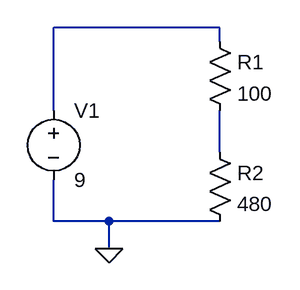
[diagram p0: schematic C5.asc]
C5.asc, the LTspice schematic file:
Version 4
SHEET 1 880 680
WIRE 272 32 80 32
WIRE 272 48 272 32
WIRE 80 128 80 32
WIRE 272 176 272 128
WIRE 80 256 80 208
WIRE 144 256 80 256
WIRE 272 256 144 256
WIRE 144 288 144 256
FLAG 144 288 0
SYMBOL res 256 32 R0
SYMATTR InstName R1
SYMATTR Value 100
SYMBOL res 256 160 R0
SYMATTR InstName R2
SYMATTR Value 480
SYMBOL voltage 80 112 R0
WINDOW 123 0 0 Left 0
WINDOW 39 0 0 Left 0
SYMATTR InstName V1
SYMATTR Value 9

The netlist it stands for:
* C5.asc
R1 N001 N002 100
R2 N002 0 480
V1 N001 0 9
.backanno
.end